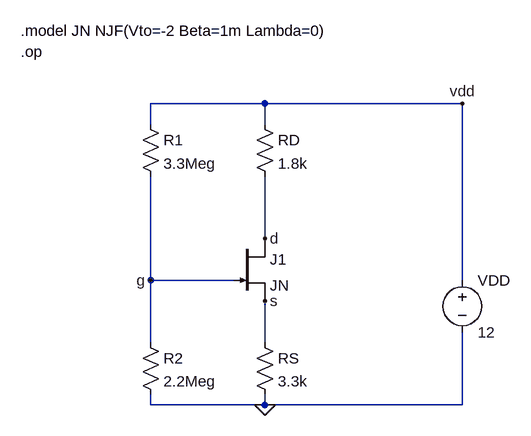
[diagram p0: schematic Ex04.asc]
Ex04.asc, the LTspice schematic file:
Version 4.1
SHEET 1 1200 800
WIRE 176 -64 0 -64
WIRE 480 -64 176 -64
WIRE 0 -32 0 -64
WIRE 176 -32 176 -64
WIRE 176 144 176 48
WIRE 0 208 0 48
WIRE 128 208 0 208
WIRE 480 208 480 -64
WIRE 0 304 0 208
WIRE 176 304 176 240
WIRE 0 400 0 384
WIRE 176 400 176 384
WIRE 176 400 0 400
WIRE 480 400 480 288
WIRE 480 400 176 400
FLAG 176 400 0
FLAG 480 -64 vdd
FLAG 0 208 g
FLAG 176 144 d
FLAG 176 240 s
SYMBOL njf 128 144 R0
SYMATTR InstName J1
SYMATTR Value JN
SYMBOL res 160 -48 R0
SYMATTR InstName RD
SYMATTR Value 1.8k
SYMBOL res 160 288 R0
SYMATTR InstName RS
SYMATTR Value 3.3k
SYMBOL res -16 -48 R0
SYMATTR InstName R1
SYMATTR Value 3.3Meg
SYMBOL res -16 288 R0
SYMATTR InstName R2
SYMATTR Value 2.2Meg
SYMBOL voltage 480 192 R0
SYMATTR InstName VDD
SYMATTR Value 12
TEXT -200 -176 Left 2 !.model JN NJF(Vto=-2 Beta=1m Lambda=0)
TEXT -200 -144 Left 2 !.op

The netlist it stands for:
* Ex04.asc
J1 d g s JN
RD vdd d 1.8k
RS s 0 3.3k
R1 vdd g 3.3Meg
R2 g 0 2.2Meg
VDD vdd 0 12
.model NJF NJF
.model PJF PJF
.lib standard.jft
.model JN NJF(Vto=-2 Beta=1m Lambda=0)
.op
.backanno
.end